# Altium project pcbrw_drv.PrjPCB
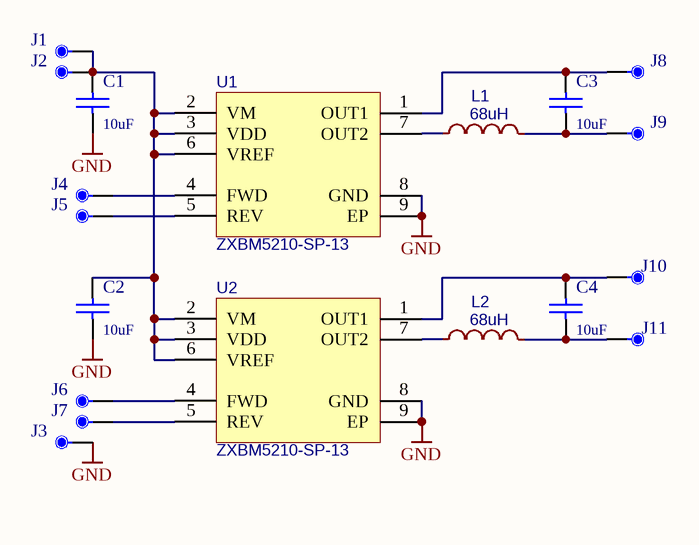
[diagram p0: schematic.SchDoc]
PRJ_VER: v1.0.0
1 sheet, 19 parts. Net scope: global (net labels, ports and power ports of the same name join across sheets).
Board file: board.PcbDoc

## Sheet schematic.SchDoc
size A4; SheetNumber: 6; SheetTotal: 29

### Parts
C1  10uF  [C1210]
C2  10uF  [C1210]
C3  10uF  [C1210]
C4  10uF  [C1210]
J1  undef  [TP30_SMD]  (value not drawn)
J2  undef  [TP30_SMD]  (value not drawn)
J3  undef  [TP30_SMD]  (value not drawn)
J4  undef  [TP30_SMD]  (value not drawn)
J5  undef  [TP30_SMD]  (value not drawn)
J6  undef  [TP30_SMD]  (value not drawn)
J7  undef  [TP30_SMD]  (value not drawn)
J8  undef  [TP30_SMD]  (value not drawn)
J9  undef  [TP30_SMD]  (value not drawn)
J10  undef  [TP30_SMD]  (value not drawn)
J11  undef  [TP30_SMD]  (value not drawn)
L1  68uH  [IND-SMD_L13.8-W12.6]
L2  68uH  [IND-SMD_L13.8-W12.6]
U1  ZXBM5210-SP-13  [PowerSOIC-8]
U2  ZXBM5210-SP-13  [PowerSOIC-8]

### Nets
GND: C1.1 C2.1 J3.1 U1.8(GND) U1.9(EP) U2.8(GND) U2.9(EP)
NetC1_2: C1.2 C2.2 J1.1 J2.1 U1.2(VM) U1.3(VDD) U1.6(VREF) U2.2(VM) U2.3(VDD) U2.6(VREF)
NetC3_1: C3.1 J9.1 L1.2
NetC3_2: C3.2 J8.1 U1.1(OUT1)
NetC4_1: C4.1 J11.1 L2.2
NetC4_2: C4.2 J10.1 U2.1(OUT1)
NetJ4_1: J4.1 U1.4(FWD)
NetJ5_1: J5.1 U1.5(REV)
NetJ6_1: J6.1 U2.4(FWD)
NetJ7_1: J7.1 U2.5(REV)
NetL1_1: L1.1 U1.7(OUT2)
NetL2_1: L2.1 U2.7(OUT2)

### Library data of the parts
C1-C4 = CAP: 10uF 1210
J1-J11 = TP_Dup1
L1 L2 = 4.7uH: CKST1206-68uH/M